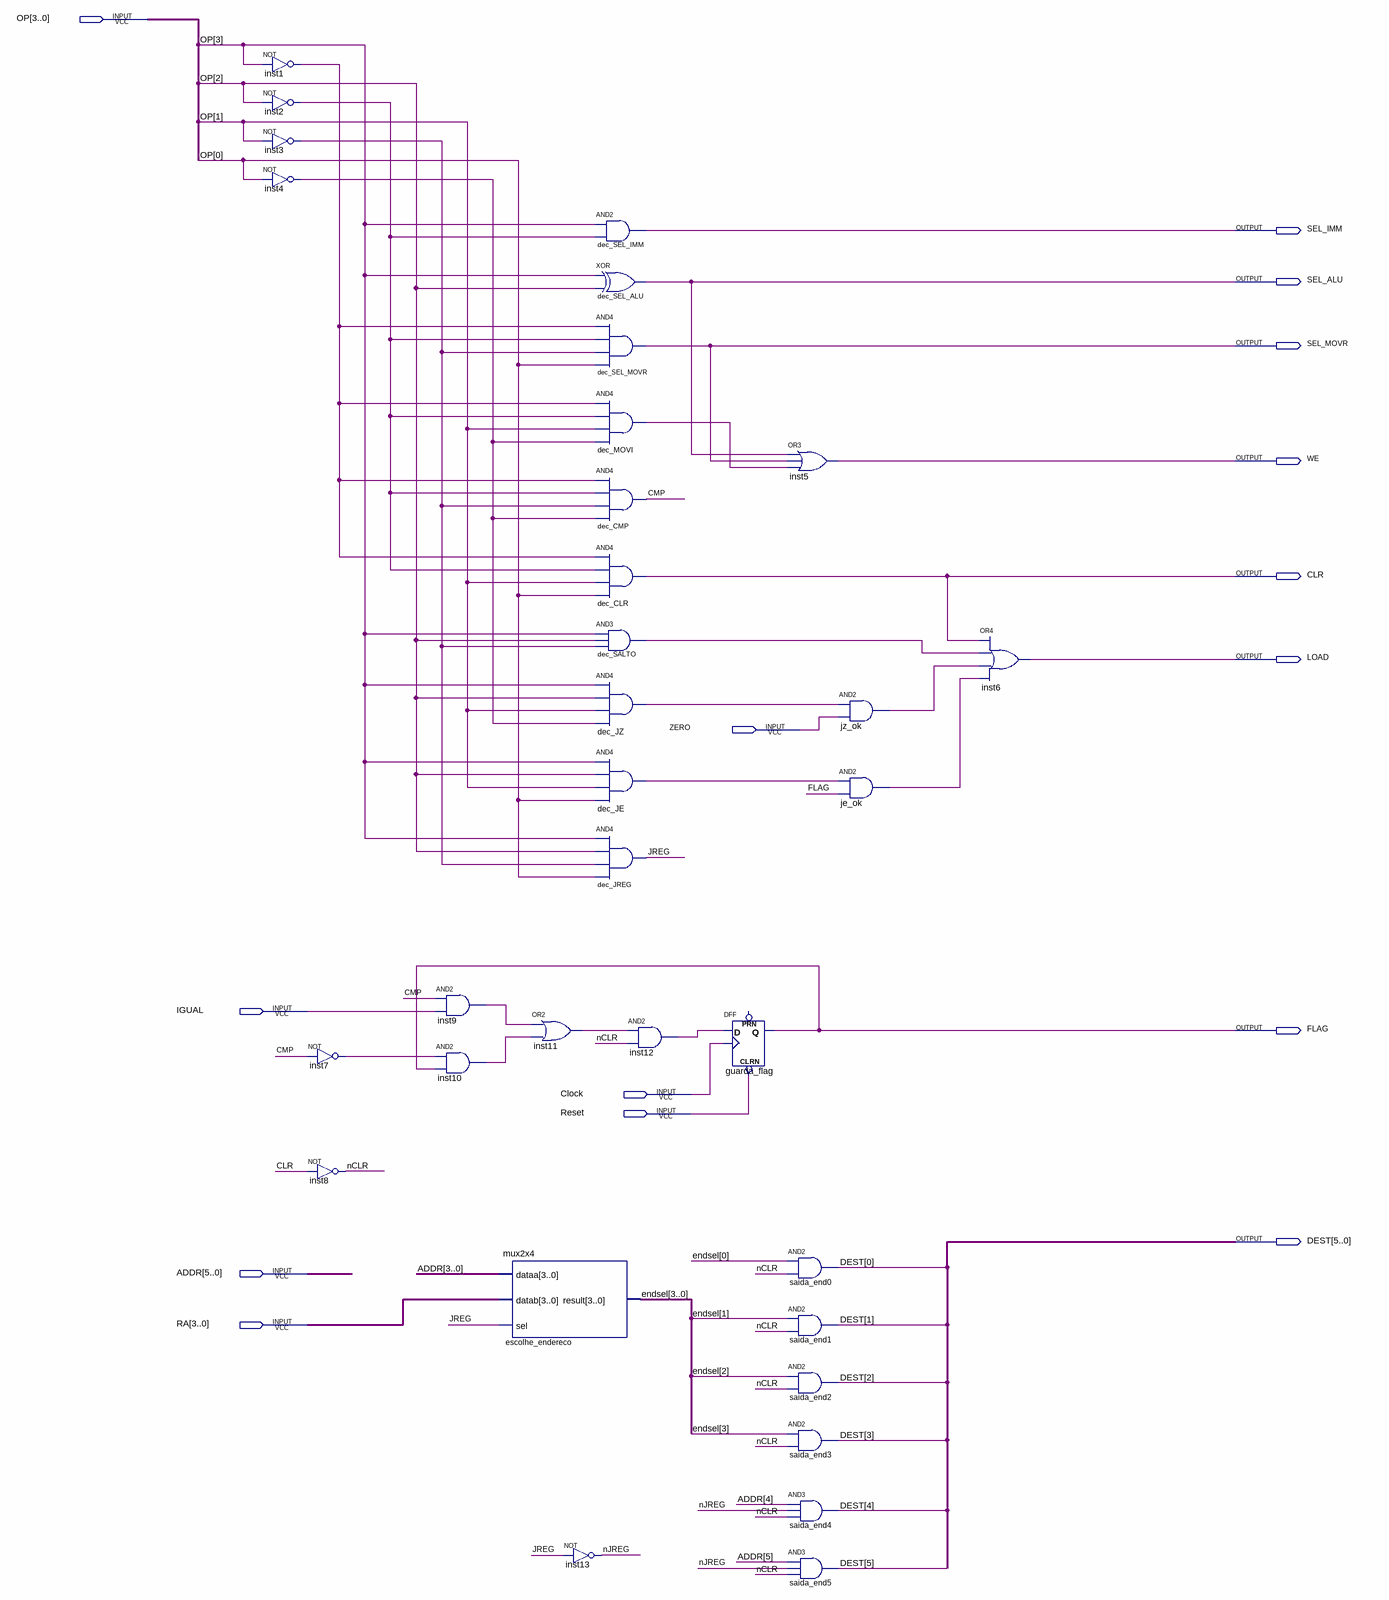
[diagram p0: schematic sheet]
// Quartus schematic unidade_controle.bdf as structural Verilog: 33 symbols, 15 pins
module unidade_controle (
  input  [3:0] OP,
  input  ZERO,
  input  IGUAL,
  input  Clock,
  input  Reset,
  input  [5:0] ADDR,
  input  [3:0] RA,
  output SEL_IMM,
  output SEL_ALU,
  output SEL_MOVR,
  output WE,
  output CLR,
  output LOAD,
  output FLAG,
  output [5:0] DEST
);

  wire CMP, dec_JE_out, dec_JZ_out, dec_MOVI_out, dec_SALTO_out, inst1_out, inst2_out, inst3_out, inst4_out,
       inst7_out, inst9_out, inst10_out, inst11_out, inst12_out, je_ok_out, JREG, jz_ok_out, nCLR, nJREG;
  wire [3:0] endsel;

  not inst1 (inst1_out, OP[3]);
  not inst2 (inst2_out, OP[2]);
  not inst3 (inst3_out, OP[1]);
  not inst4 (inst4_out, OP[0]);
  not inst7 (inst7_out, CMP);
  not inst8 (nCLR, CLR);
  and inst9 (inst9_out, CMP, IGUAL);
  and inst10 (inst10_out, inst7_out, FLAG);
  or inst11 (inst11_out, inst9_out, inst10_out);
  mux2x4 escolhe_endereco (.dataa(ADDR[3:0]), .datab(RA), .sel(JREG), .result(endsel));
  and dec_SEL_IMM (SEL_IMM, OP[3], inst2_out);
  xor dec_SEL_ALU (SEL_ALU, OP[3], OP[2]);
  and dec_SEL_MOVR (SEL_MOVR, inst1_out, inst2_out, inst3_out, OP[0]);
  and dec_MOVI (dec_MOVI_out, inst1_out, inst2_out, OP[1], inst4_out);
  and dec_CMP (CMP, inst1_out, inst2_out, inst3_out, inst4_out);
  and dec_CLR (CLR, inst1_out, inst2_out, OP[1], OP[0]);
  and dec_SALTO (dec_SALTO_out, OP[3], OP[2], inst3_out);
  and dec_JZ (dec_JZ_out, OP[3], OP[2], OP[1], inst4_out);
  and dec_JE (dec_JE_out, OP[3], OP[2], OP[1], OP[0]);
  and dec_JREG (JREG, OP[3], OP[2], inst3_out, OP[0]);
  not inst13 (nJREG, JREG);
  and inst12 (inst12_out, inst11_out, nCLR);
  DFF guarda_flag (.CLRN(Reset), .CLK(Clock), .D(inst12_out), .Q(FLAG));  // open: PRN
  or inst5 (WE, SEL_ALU, SEL_MOVR, dec_MOVI_out);
  and saida_end0 (DEST[0], endsel[0], nCLR);
  and saida_end1 (DEST[1], endsel[1], nCLR);
  and saida_end2 (DEST[2], endsel[2], nCLR);
  and saida_end3 (DEST[3], endsel[3], nCLR);
  and saida_end4 (DEST[4], ADDR[4], nJREG, nCLR);
  and saida_end5 (DEST[5], ADDR[5], nJREG, nCLR);
  and jz_ok (jz_ok_out, dec_JZ_out, ZERO);
  and je_ok (je_ok_out, dec_JE_out, FLAG);
  or inst6 (LOAD, CLR, dec_SALTO_out, jz_ok_out, je_ok_out);
endmodule
